# Altium schematic sheet Power-Sheet.SchDoc (part 3 of 3)
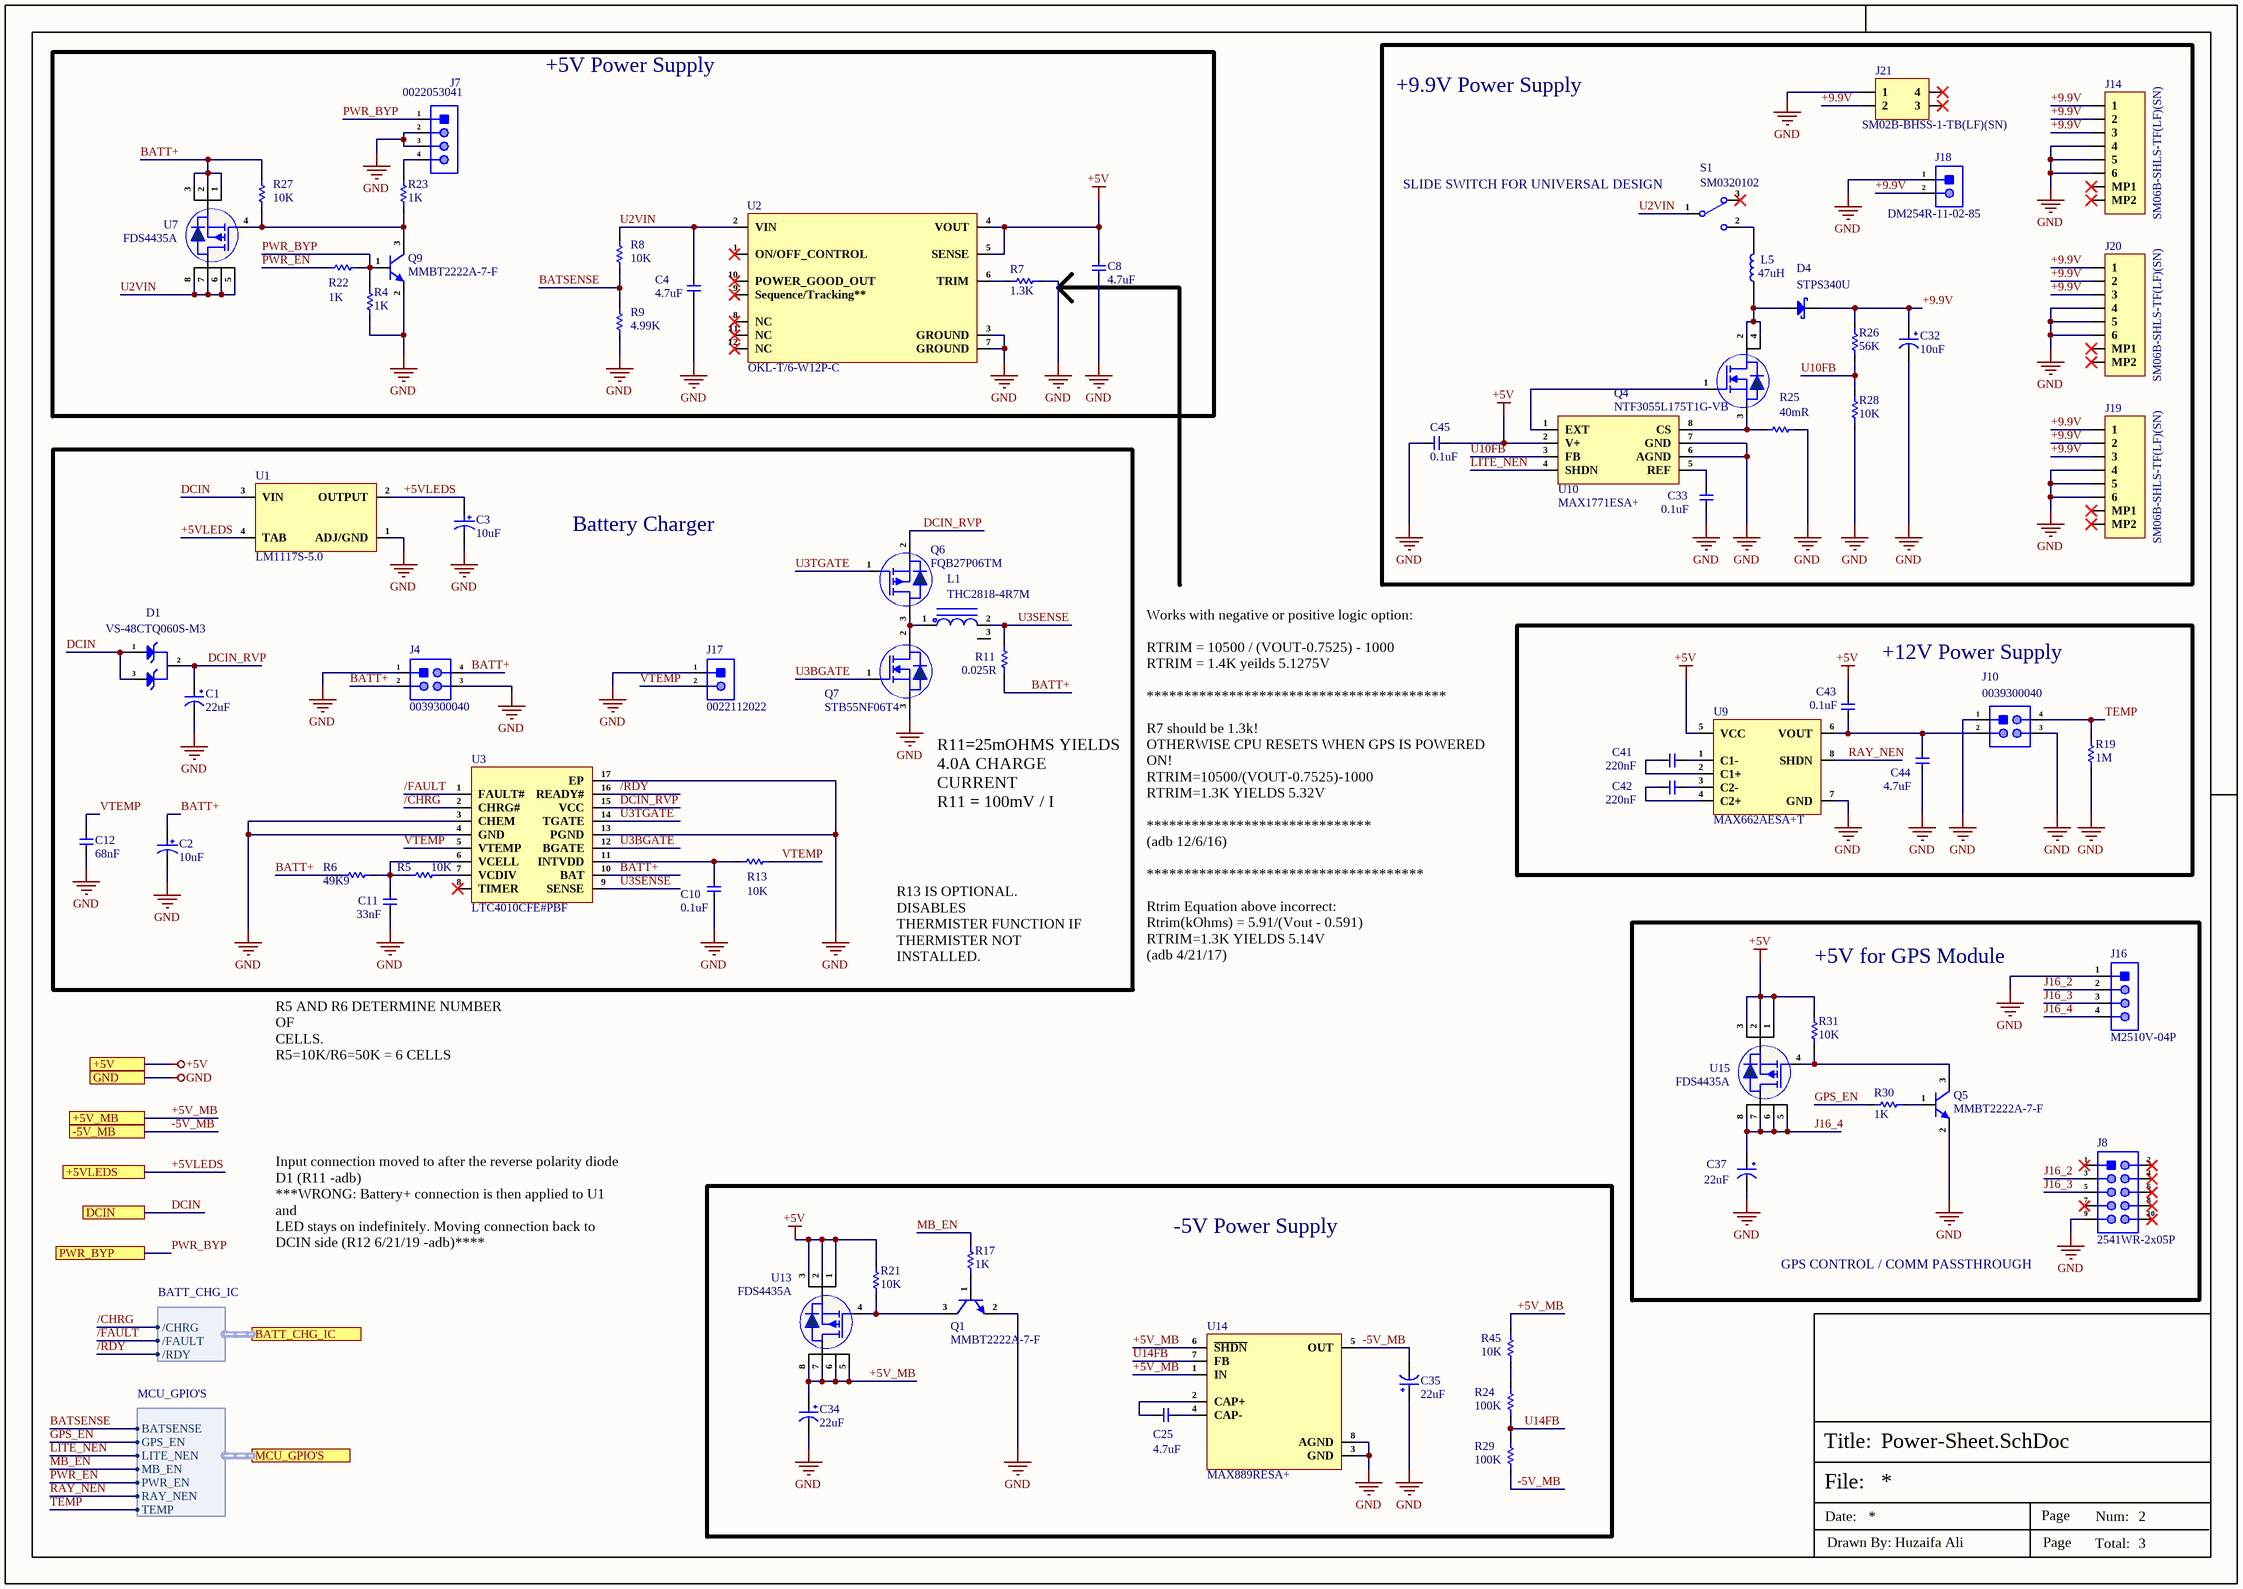
[diagram p2: Power-Sheet.SchDoc]

## Library data of the parts (continued)
U10 = MAX1771ESA+: Switching Controllers 12V or Adjustable, High-Efficiency, Low IQ, Step-Up DC-DC Controller; Manufacturer: Maxim; Item Type: IC; Supplier: Mouser; Supplier Part Number: 700-MAX1771ESA; Manufacturer Part Number: MAX1771ESA+; RoHS: Yes; Stock: 3278; Pricing: 1=7.36, 10=6.33, 50=6.23, 100=5.5, 1000=4.19, 10000=4.19 (USD); ComponentLink1URL: https://datasheet.ciiva.com/4877/max1771-100479-4877792.pdf?src-supplier=Mouser; ComponentLink1Description: https://datasheet.ciiva.com/4877/max1771-100479-4877792.pdf?src-supplier=Mouser; ComponentLink2URL: https://datasheet.ciiva.com/14150/max1771-eng-tds-14150776.pdf?src-supplier=Distrelec; ComponentLink2Description: https://datasheet.ciiva.com/14150/max1771-eng-tds-14150776.pdf?src-supplier=Distrelec; ComponentLink3URL: https://datasheet.ciiva.com/3217/max1771-3217307.pdf?src-supplier=Avnet; ComponentLink3Description: https://datasheet.ciiva.com/3217/max1771-3217307.pdf?src-supplier=Avnet; ComponentLink4URL: https://datasheet.ciiva.com/2016/max1771-2016789.pdf?src-supplier=Digikey; ComponentLink4Description: https://datasheet.ciiva.com/2016/max1771-2016789.pdf?src-supplier=Digikey
U14 = MAX889RESA+: IC REG CHRG PUMP ADJ 200MA 8SOIC; Manufacturer: Maxim; Supplier: Mouser; Supplier Part Number: 700-MAX889RESA; Manufacturer Part Number: MAX889RESA+; RoHS: Yes; Item Type: IC; Stock: 621; Pricing: 1=6.21, 10=5.28, 50=5.28, 100=4.56, 1000=3.28, 10000=3.11 (USD); ComponentLink1URL: https://datasheet.ciiva.com/30477/0900766b81253d0c-30477617.pdf?src-supplier=Rs; ComponentLink1Description: https://datasheet.ciiva.com/30477/0900766b81253d0c-30477617.pdf?src-supplier=Rs; ComponentLink2URL: https://datasheet.ciiva.com/3215/max889-3215733.pdf?src-supplier=Avnet; ComponentLink2Description: https://datasheet.ciiva.com/3215/max889-3215733.pdf?src-supplier=Avnet; ComponentLink3URL: https://datasheet.ciiva.com/4874/max889-4874923.pdf?src-supplier=Mouser; ComponentLink3Description: https://datasheet.ciiva.com/4874/max889-4874923.pdf?src-supplier=Mouser; ComponentLink4URL: https://datasheet.ciiva.com/2028/max889-2028980.pdf?src-supplier=Digikey; ComponentLink4Description: https://datasheet.ciiva.com/2028/max889-2028980.pdf?src-supplier=Digikey